# Altium schematic sheet 60_ETHERNET.SchDoc
size 297 x 209 mm
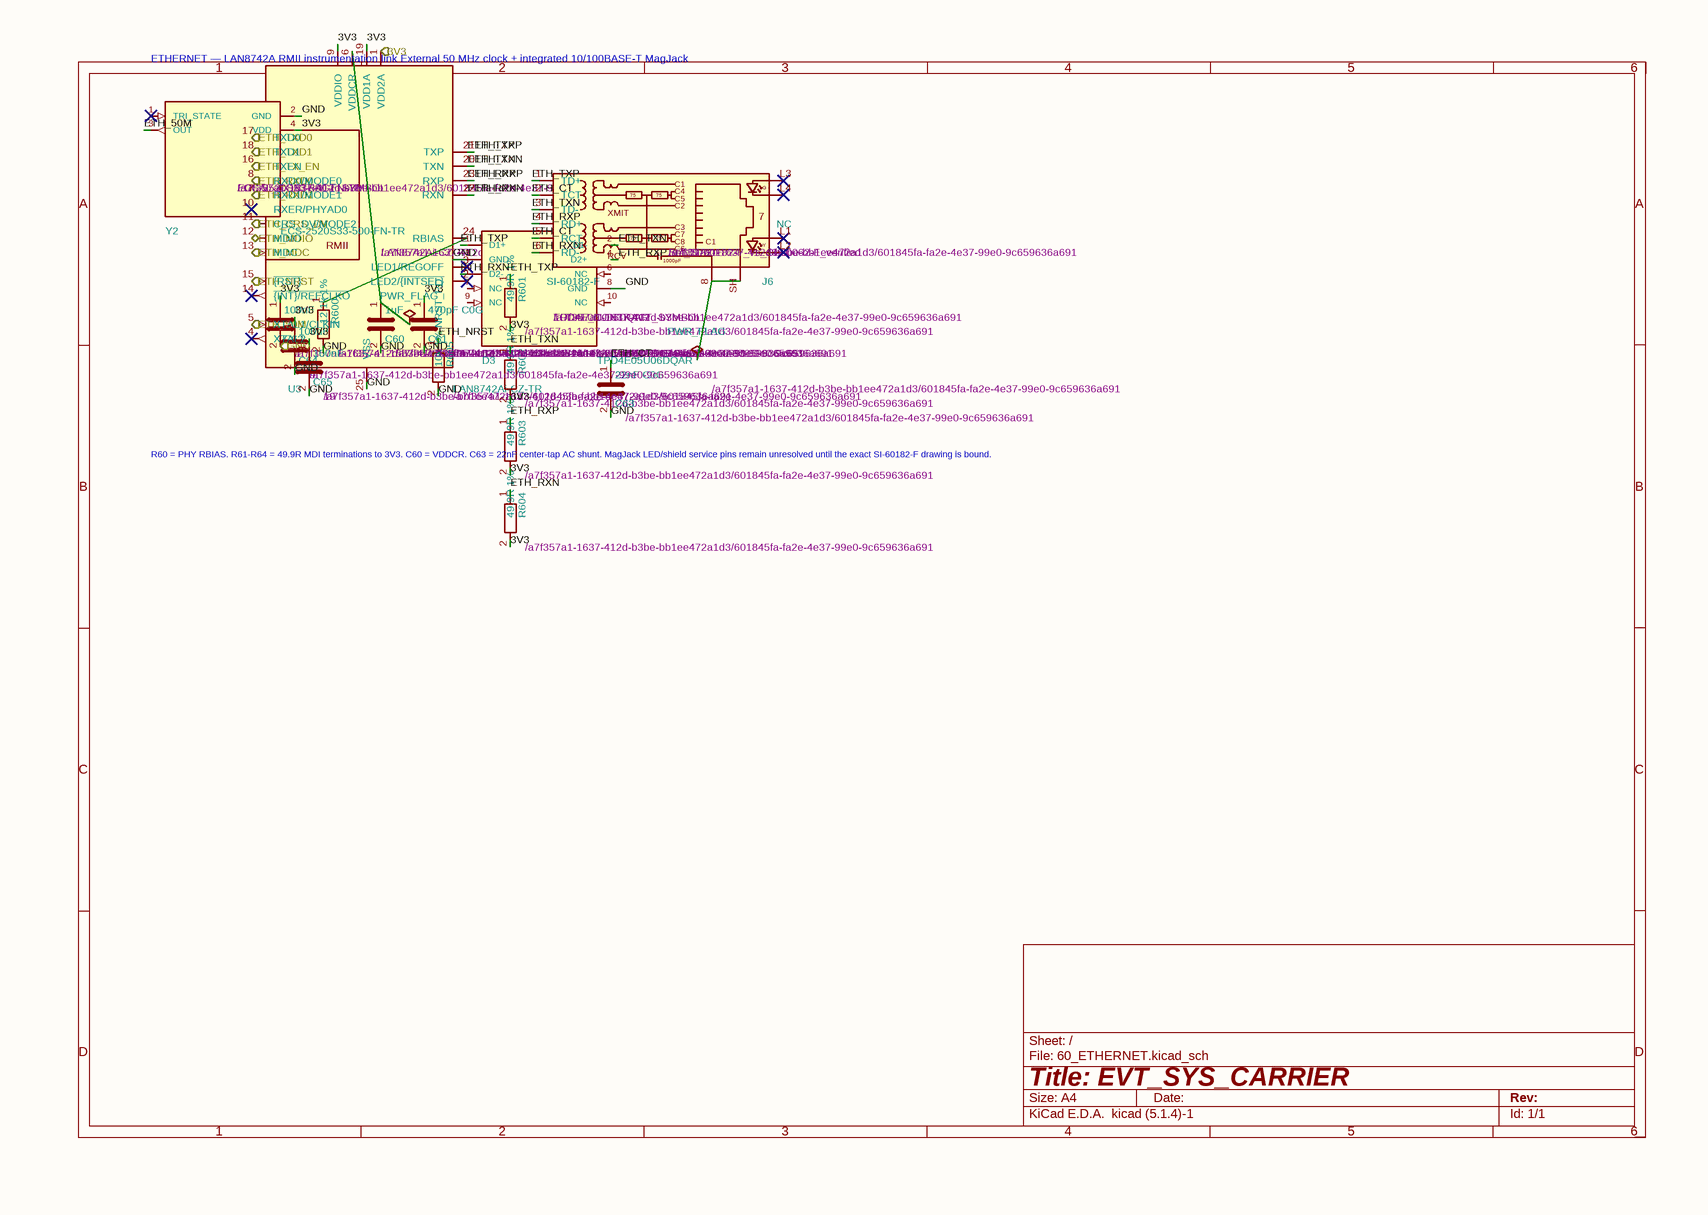
[diagram p0: 60_ETHERNET.SchDoc]

## Parts
#FLG0601  hierarchy_path: /a7f357a1-1637-412d-b3be-bb1ee472a1d3/601845fa-fa2e-4e37-99e0-9c659636a691  (hidden comment: PWR_FLAG)  (graphical)
#FLG0602  hierarchy_path: /a7f357a1-1637-412d-b3be-bb1ee472a1d3/601845fa-fa2e-4e37-99e0-9c659636a691  (hidden comment: PWR_FLAG)  (graphical)
C60  hierarchy_path: /a7f357a1-1637-412d-b3be-bb1ee472a1d3/601845fa-fa2e-4e37-99e0-9c659636a691  (hidden comment: 1uF)
C61  hierarchy_path: /a7f357a1-1637-412d-b3be-bb1ee472a1d3/601845fa-fa2e-4e37-99e0-9c659636a691  (hidden comment: 470pF C0G)
C62  Decouples_U3_Pin: 1  hierarchy_path: /a7f357a1-1637-412d-b3be-bb1ee472a1d3/601845fa-fa2e-4e37-99e0-9c659636a691  (hidden comment: 100nF)
C63  hierarchy_path: /a7f357a1-1637-412d-b3be-bb1ee472a1d3/601845fa-fa2e-4e37-99e0-9c659636a691  (hidden comment: 22nF C0G)
C64  Decouples_U3_Pin: 9  hierarchy_path: /a7f357a1-1637-412d-b3be-bb1ee472a1d3/601845fa-fa2e-4e37-99e0-9c659636a691  (hidden comment: 100nF)
C65  Decouples_U3_Pin: 19  hierarchy_path: /a7f357a1-1637-412d-b3be-bb1ee472a1d3/601845fa-fa2e-4e37-99e0-9c659636a691  (hidden comment: 100nF)
D3  Capture_Status: LOCAL_CONTRACT_SYMBOL  hierarchy_path: /a7f357a1-1637-412d-b3be-bb1ee472a1d3/601845fa-fa2e-4e37-99e0-9c659636a691  (hidden comment: TPD4E05U06DQAR)
J6  Compatibility_Basis: Bel_SI-60182-F_vs_SI-60062-F_verified  hierarchy_path: /a7f357a1-1637-412d-b3be-bb1ee472a1d3/601845fa-fa2e-4e37-99e0-9c659636a691  [RJ45_Bel_SI-60062-F]  (hidden comment: SI-60182-F)
R600  hierarchy_path: /a7f357a1-1637-412d-b3be-bb1ee472a1d3/601845fa-fa2e-4e37-99e0-9c659636a691  (hidden comment: 12.1k 1%)
R601  hierarchy_path: /a7f357a1-1637-412d-b3be-bb1ee472a1d3/601845fa-fa2e-4e37-99e0-9c659636a691  (hidden comment: 49.9R 1%)
R602  hierarchy_path: /a7f357a1-1637-412d-b3be-bb1ee472a1d3/601845fa-fa2e-4e37-99e0-9c659636a691  (hidden comment: 49.9R 1%)
R603  hierarchy_path: /a7f357a1-1637-412d-b3be-bb1ee472a1d3/601845fa-fa2e-4e37-99e0-9c659636a691  (hidden comment: 49.9R 1%)
R604  hierarchy_path: /a7f357a1-1637-412d-b3be-bb1ee472a1d3/601845fa-fa2e-4e37-99e0-9c659636a691  (hidden comment: 49.9R 1%)
R605  hierarchy_path: /a7f357a1-1637-412d-b3be-bb1ee472a1d3/601845fa-fa2e-4e37-99e0-9c659636a691  (hidden comment: 10k 1% NRST_PD)
U3  hierarchy_path: /a7f357a1-1637-412d-b3be-bb1ee472a1d3/601845fa-fa2e-4e37-99e0-9c659636a691  (hidden comment: LAN8742Ai-CZ-TR)
Y2  Capture_Status: LOCAL_CONTRACT_SYMBOL  hierarchy_path: /a7f357a1-1637-412d-b3be-bb1ee472a1d3/601845fa-fa2e-4e37-99e0-9c659636a691  (hidden comment: ECS-2520S33-500-FN-TR)

## Ports
3V3 (in), ETH_50M (out), ETH_CRS_DV (out), ETH_MDC (in), ETH_MDIO (bidir), ETH_NRST (in), ETH_RXD0 (out), ETH_RXD1 (out), ETH_TX_EN (in), ETH_TXD0 (in), ETH_TXD1 (in), GND

## Nets
3V3: U3.1(VDD2A) ; port 3V3
3V3: C61.1 C62.1 C64.1 C65.1 R601.2 R602.2 R603.2 R604.2 U3.9(VDDIO) U3.19(VDD1A) Y2.4(VDD)  [a separate net that carries the same name]
ETH_50M: U3.5(XTAL1/CLKIN) ; port ETH_50M
ETH_50M: Y2.3(OUT)  [a separate net that carries the same name]
ETH_CRS_DV: U3.11(CRS_DV/MODE2) ; port ETH_CRS_DV
ETH_CT: C63.1 J6.2(TCT) J6.5(RCT)
ETH_MDC: U3.13(MDC) ; port ETH_MDC
ETH_MDIO: U3.12(MDIO) ; port ETH_MDIO
ETH_NRST: U3.15(~{{RST}}) ; port ETH_NRST
ETH_NRST: R605.1  [a separate net that carries the same name]
ETH_RXD0: U3.8(RXD0/MODE0) ; port ETH_RXD0
ETH_RXD1: U3.7(RXD1/MODE1) ; port ETH_RXD1
ETH_RXN: D3.5(D2-) J6.6(RD-) R604.1 U3.22(RXN)
ETH_RXP: D3.4(D2+) J6.4(RD+) R603.1 U3.23(RXP)
ETH_TX_EN: U3.16(TXEN) ; port ETH_TX_EN
ETH_TXD0: U3.17(TXD0) ; port ETH_TXD0
ETH_TXD1: U3.18(TXD1) ; port ETH_TXD1
ETH_TXN: D3.2(D1-) J6.3(TD-) R602.1 U3.20(TXN)
ETH_TXP: D3.1(D1+) J6.1(TD+) R601.1 U3.21(TXP)
GND: C60.2 C61.2 C63.2 C64.2 C65.2 D3.3(GND) D3.8(GND) R600.2 R605.2 U3.25(VSS) Y2.2(GND)
GND: C62.2 ; port GND  [a separate net that carries the same name]
Net#FLG0601_1: #FLG0601.1 C60.1 U3.6(VDDCR)
Net#FLG0602_1: #FLG0602.1 J6.8 J6.SH
NetR600_1: R600.1 U3.24(RBIAS)

Not connected (* = marked no-connect by the designer): D3 6(NC) 7(NC) 9(NC) 10(NC); J6 7(NC) L1* L2* L3* L4*; U3 2(LED2/~{{INTSEL}})* 3(LED1/REGOFF)* 4(XTAL2)* 10(RXER/PHYAD0)* 14(~{{INT}/REFCLKO})*; Y2 1(TRI_STATE)*

## Notes on the sheet
- (near U3) ETHERNET — LAN8742A RMII instrumentation link
  External 50 MHz clock + integrated 10/100BASE-T MagJack
- (near R603) R60 = PHY RBIAS. R61-R64 = 49.9R MDI terminations to 3V3.
  C60 = VDDCR. C63 = 22nF center-tap AC shunt.
  MagJack LED/shield service pins remain unresolved until the exact SI-60182-F drawing is bound.
- 1
- 2
- 3
- 4
- 5
- 6
- A
- B
- C
- D
- Title: EVT_SYS_CARRIER
- File: 60_ETHERNET.kicad_sch
- Sheet: /
- KiCad E.D.A.  kicad (5.1.4)-1
- Size: A4
- Date:
- Rev:
- Id: 1/1
- (in symbol LAN8742A) RMII
- (in symbol RJ45_Bel_SI-60062-F) C4; C1; G; 75; C2; C5; XMIT; C7; C3; C6; C8; Y; RCV; 1000pF

## Library data of the parts
C60-C65 = C
  C60: Value: 1uF
  C61: Value: 470pF C0G
  C62 C64 C65: Value: 100nF
  C63: Value: 22nF C0G
J6 = RJ45_Bel_SI-60062-F: MPN: SI-60182-F; Value: SI-60182-F; Footprint: Connector_RJ:RJ45_Bel_SI-60062-F
R600-R605 = R
  R600: Value: 12.1k 1%
  R601-R604: Value: 49.9R 1%
  R605: Value: 10k 1% NRST_PD
U3 = LAN8742A: MPN: LAN8742Ai-CZ-TR; Value: LAN8742Ai-CZ-TR
#FLG0601 #FLG0602 = PWR_FLAG: Value: PWR_FLAG
D3 = TPD4E05U06DQAR: MPN: TPD4E05U06DQAR; Value: TPD4E05U06DQAR
Y2 = ECS-2520S33-500-FN-TR: MPN: ECS-2520S33-500-FN-TR; Value: ECS-2520S33-500-FN-TR